# Altium project DB27408+.PrjPcb
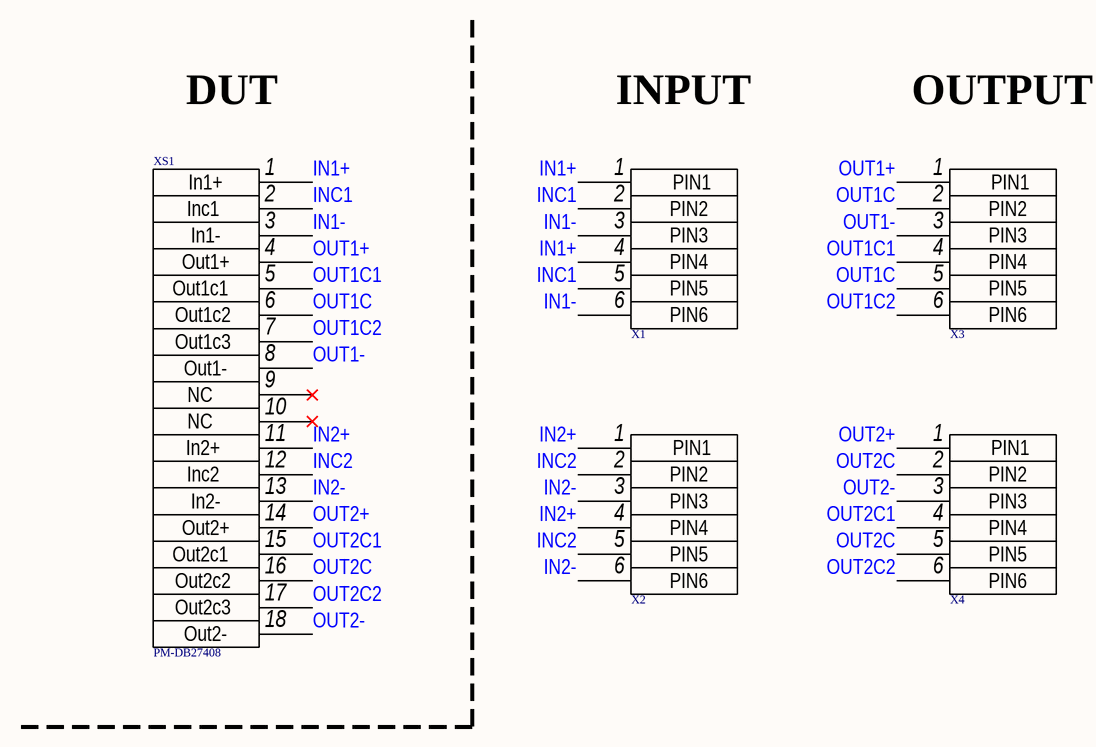
[diagram p0: kY-383-PM-DB27408.SchDoc]
1 sheet, 5 parts. Net scope: global (net labels, ports and power ports of the same name join across sheets).
Board file: PM-DB27408+.PcbDoc

## Sheet kY-383-PM-DB27408.SchDoc
size 410 x 297 mm; Author: Рекуненко Д.В.; Address1: Address1; Address2: Address2; Address3: Address3; Address4: Address4; DocumentNumber: KY-383-PM-DB27408; SheetNumber: 1; SheetTotal: 2; Scale: 1:1; DocumentType: Схема электрическая принципиальная; FirstReferrence: АБВГ.123456.001

### Parts
X1  PLD-12  [PLD-12]  (value not drawn)
X2  PLD-12  [PLD-12]  (value not drawn)
X3  PLD-12  [PLD-12]  (value not drawn)
X4  PLD-12  [PLD-12]  (value not drawn)
XS1  PM-DB27408  [7H]

### Nets
IN1+: X1.1 X1.4 XS1.1
IN1-: X1.3 X1.6 XS1.3
IN2+: X2.1 X2.4 XS1.11
IN2-: X2.3 X2.6 XS1.13
INC1: X1.2 X1.5 XS1.2
INC2: X2.2 X2.5 XS1.12
OUT1+: X3.1 XS1.4
OUT1-: X3.3 XS1.8
OUT1C: X3.2 X3.5 XS1.6
OUT1C1: X3.4 XS1.5
OUT1C2: X3.6 XS1.7
OUT2+: X4.1 XS1.14
OUT2-: X4.3 XS1.18
OUT2C: X4.2 X4.5 XS1.16
OUT2C1: X4.4 XS1.15
OUT2C2: X4.6 XS1.17

Not connected (* = marked no-connect by the designer): XS1 9* 10*

### Notes on the sheet
- DUT
- INPUT
- OUTPUT
- Перв. примен.
- Справ. №
- Подп. и дата
- Инв. № дубл.
- Взам. инв. №
- Разраб.
- Изм.
- Лист
- № докум.
- Подп.
- Дата
- Литера
- Масса
- Масштаб
- Пров.
- Т.контр.
- Листов
- Инв. № подл.
- Н.контр.
- Утв.
- Форма 1 ГОСТ 2.104-2006
- Копировал
- Формат А3
- (in symbol PLD-12) PIN1; PIN2; PIN3; PIN4; PIN5; PIN6
- (in symbol PM-DB27408) In1+; Inc1; In1-; Out1+; Out1c1; Out1c2; Out1c3; Out1-; NC; In2+; Inc2; In2-; Out2+; Out2c1; Out2c2; Out2c3; Out2-